# Altium schematic sheet jlink_full.SchDoc
size A4; SheetNumber: 3; SheetTotal: 4
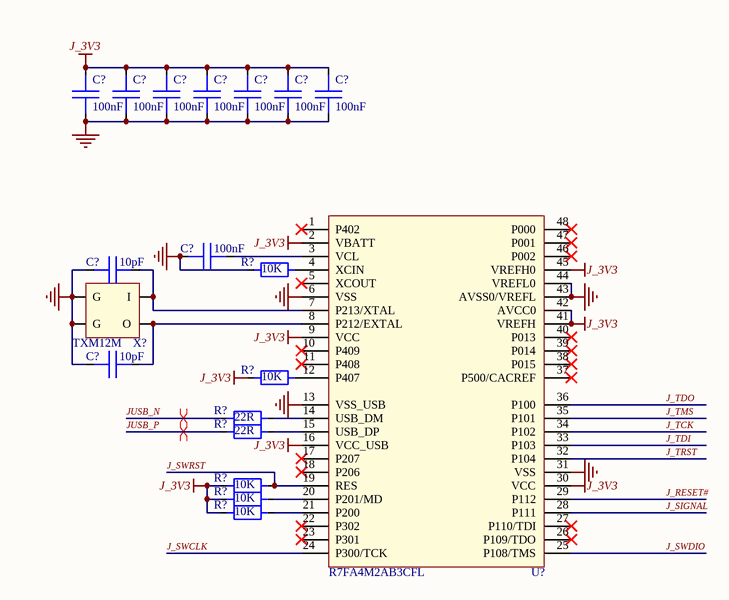
[diagram p0: jlink_full.SchDoc]

## Parts
(Parts that share a designator on the sheet are numbered #1, #2 ... from top to bottom, then left to right.)
C?#1  100nF  [C0402]
C?#2  100nF  [C0402]
C?#3  100nF  [C0402]
C?#4  100nF  [C0402]
C?#5  100nF  [C0402]
C?#6  100nF  [C0402]
C?#7  100nF  [C0402]
C?#8  100nF  [C0402]
C?#9  10pF  [C0402]
C?#10  10pF  [C0402]
R?#1  10K  [R0402]
R?#2  10K  [R0402]
R?#3  22R  [R0402]
R?#4  22R  [R0402]
R?#5  10K  [R0402]
R?#6  10K  [R0402]
R?#7  10K  [R0402]
U?  R7FA4M2AB3CFL  [LQFP48]
X?  TXM12M  [SMD2520-4P]

## Nets
GND: C?#1.2 C?#2.2 C?#3.2 C?#4.2 C?#5.2 C?#6.2 C?#7.2 C?#8.1 C?#9.1 C?#10.1 R?#1.1 U?.6(VSS) U?.13(VSS_USB) U?.31(VSS) U?.43(AVSS0/VREFL) U?.44(VREFL0) X?.2(G) X?.4(G)
J_3V3: C?#1.1 C?#2.1 C?#3.1 C?#4.1 C?#5.1 C?#6.1 C?#7.1 R?#2.1 R?#5.1 R?#6.1 R?#7.1 U?.2(VBATT) U?.9(VCC) U?.16(VCC_USB) U?.30(VCC) U?.41(VREFH) U?.42(AVCC0) U?.45(VREFH0)
J_RESET#: U?.29(P112)
J_SIGNAL: U?.28(P111)
J_SWCLK: U?.24(P300/TCK)
J_SWDIO: U?.25(P108/TMS)
J_SWRST: R?#5.2 U?.19(RES)
J_TCK: U?.34(P102)
J_TDI: U?.33(P103)
J_TDO: U?.36(P100)
J_TMS: U?.35(P101)
J_TRST: U?.32(P104)
JUSB_N: R?#3.1
JUSB_P: R?#4.1
NetC?#8_2: C?#8.2 U?.3(VCL)
NetC?#9_2: C?#9.2 U?.7(P213/XTAL) X?.1(I)
NetC?#10_2: C?#10.2 U?.8(P212/EXTAL) X?.3(O)
NetR?#1_2: R?#1.2 U?.4(XCIN)
NetR?#2_2: R?#2.2 U?.12(P407)
NetR?#3_2: R?#3.2 U?.14(USB_DM)
NetR?#4_2: R?#4.2 U?.15(USB_DP)
NetR?#6_2: R?#6.2 U?.20(P201/MD)
NetR?#7_2: R?#7.2 U?.21(P200)

Not connected (* = marked no-connect by the designer): U? 1(P402)* 5(XCOUT)* 10(P409)* 11(P408)* 17(P207)* 18(P206)* 22(P302)* 23(P301)* 26(P109/TDO)* 27(P110/TDI)* 37(P500/CACREF)* 38(P015)* 39(P014)* 40(P013)* 46(P002)* 47(P001)* 48(P000)*

## Layout directives
differential pair: JUSB_N, JUSB_P

## Library data of the parts
C?#1-C?#10 = Capacitor
R?#1-R?#7 = Resistance
X? = Oscillator-4: TXM12M0004252DBCEO00T